# Altium project loadcell-new_Project.PrjPcb
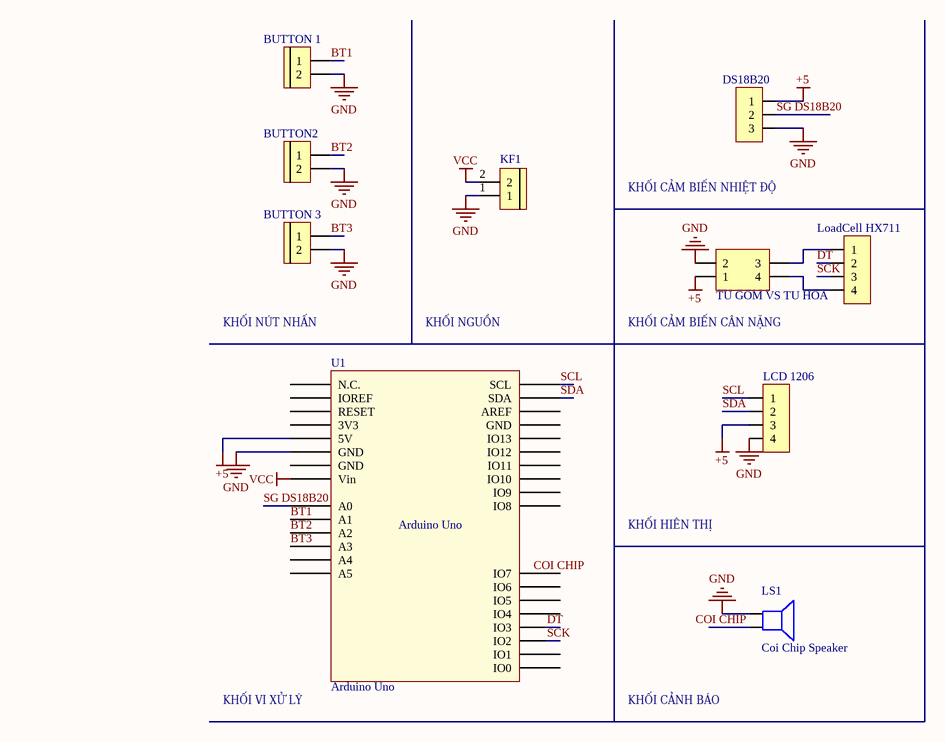
[diagram p0: loadcell.SchDoc]
1 sheet, 10 parts. Net scope: global (net labels, ports and power ports of the same name join across sheets).
Board file: loadcell.PcbDoc

## Sheet loadcell.SchDoc
size A4; SheetNumber: 1; SheetTotal: 1

### Parts
BUTTON2  (no value)  [Con 2 KF301 5.08]
BUTTON_1  (no value)  [Con 2 KF301 5.08]
BUTTON_3  (no value)  [Con 2 KF301 5.08]
JP1  LCD 1206  [JP 1x4 DT]
JP3  LoadCell HX711  [JP 1x4 DT]
JP4  DS18B20  [JP 1x3 DT]
JP5  TU GOM VS TU HOA  [JP 2x2 DT]
KF1  CON 2 KF301  [Con 2 KF301 5.08]  (value not drawn)
LS1  Coi Chip Speaker  [Coi Chip Speacker]
U1  Arduino Uno  [Arduino Uno]

### Nets
+5: JP1.3 JP4.1 JP5.1 U1.5V
GND: BUTTON2.2 BUTTON_1.2 BUTTON_3.2 JP1.4 JP4.3 JP5.2 KF1.1 LS1.1 U1.GND1(GND)
VCC: KF1.2 U1.Vin
BT1: BUTTON_1.1 U1.A1
BT2: BUTTON2.1 U1.A2
BT3: BUTTON_3.1 U1.A3
DT: JP3.2 U1.3(IO3)
SCK: JP3.3 U1.2(IO2)
SCL: JP1.1 U1.SCL
SDA: JP1.2 U1.SDA
SG DS18B20: JP4.2 U1.A0
NetJP3_1: JP3.1 JP5.3
NetJP3_4: JP3.4 JP5.4

Not connected (* = marked no-connect by the designer): LS1 2; U1 0(IO0) 1(IO1) 3V3 4(IO4) 5(IO5) 6(IO6) 7(IO7) 8(IO8) 9(IO9) 10(IO10) 11(IO11) 12(IO12) 13(IO13) A4 A5 AREF GND2(GND) GND3(GND) IOREF NC(N.C.) RESET

### Notes on the sheet
- KHỐI CẢM BIẾN NHIỆT ĐỘ
- KHỐI NÚT NHẤN
- KHỐI NGUỒN
- (near JP5) KHỐI CẢM BIẾN CÂN NẶNG
- KHỐI HIÊN THỊ
- (near U1) KHỐI VI XỬ LÝ
- KHỐI CẢNH BÁO
- Labels drawn without touching a wire or pin: COI CHIP

### Library data of the parts
BUTTON2 BUTTON_1 BUTTON_3 = CON 2 KF301: Cắm; Ma_Hang: MH000987; Ten_Linh_Kien: CON 2 KF301-2P 5.08MM Xanh Dương; Don_Vi: Con; Chung_Loai: Cắm; Ghi_Chu: *; Kieu_Chan: *
JP1 JP3 = JP 1x4 2.54 Duc Thang: Cắm; Ten_Linh_Kien: Jump Đơn Đực 2.54MM 1x40P Thẳng 11MM; Don_Vi: Con; Ma_Hang: MH000903; Ghi_Chu: *; Kieu_Chan: *; Chung_Loai: Cắm
JP4 = JP 1x3 2.54 Duc Thang: Cắm; Ten_Linh_Kien: Jump Đơn Đực 2.54MM 1x40P Thẳng 11MM; Don_Vi: Con; Ma_Hang: MH000903; Ghi_Chu: *; Kieu_Chan: *; Chung_Loai: Cắm
JP5 = JP 2x2 2.54 Duc Thang: Cắm; Ten_Linh_Kien: Jump Đôi Đực 2.54MM 2x40P Thẳng 11MM; Don_Vi: Con; Ma_Hang: MH002686; Ghi_Chu: *; Kieu_Chan: *; Chung_Loai: Cắm
KF1 = CON 2 KF301: Cắm; Ma_Hang: MH000987; Ten_Linh_Kien: CON 2 KF301-2P 5.08MM Xanh Dương; Chung_Loai: Cắm; Ghi_Chu: *; Kieu_Chan: *; Don_Vi: Con
LS1 = Coi Chip Speaker: Còi chip